# Altium schematic sheet 07_ANALOG_INPUTS.SchDoc: Схема электрическая принципиальная
size 420 x 297 mm; ApprovedBy: Скрябин; CheckedBy: Скрябин; Author: Корсунов; CompanyName: РТУ МИРЭА; SheetNumber: 7; SheetTotal: 11; PageSetup: Record=PageOptions|CenterHorizontal=True|CenterVertical=True|PrintScale=0.94|XCorrection=1.00|YCorrection=1.00|PrintKind=1|BorderSize=5000000|LeftOffset=0|BottomOffset=0|Orientation=1|PaperLength=1000|PaperWidth=1000|Scale=100|PaperSource=7|PrintQuality=-4|MediaType=1|DitherType=10|PaperKind=A4|PrintScaleMode=1; DecimalNumber: RP23.000001.007 Э3; Name1: Модуль ввода-вывода; lit_A: О; Name2: RP2350 OPC UA
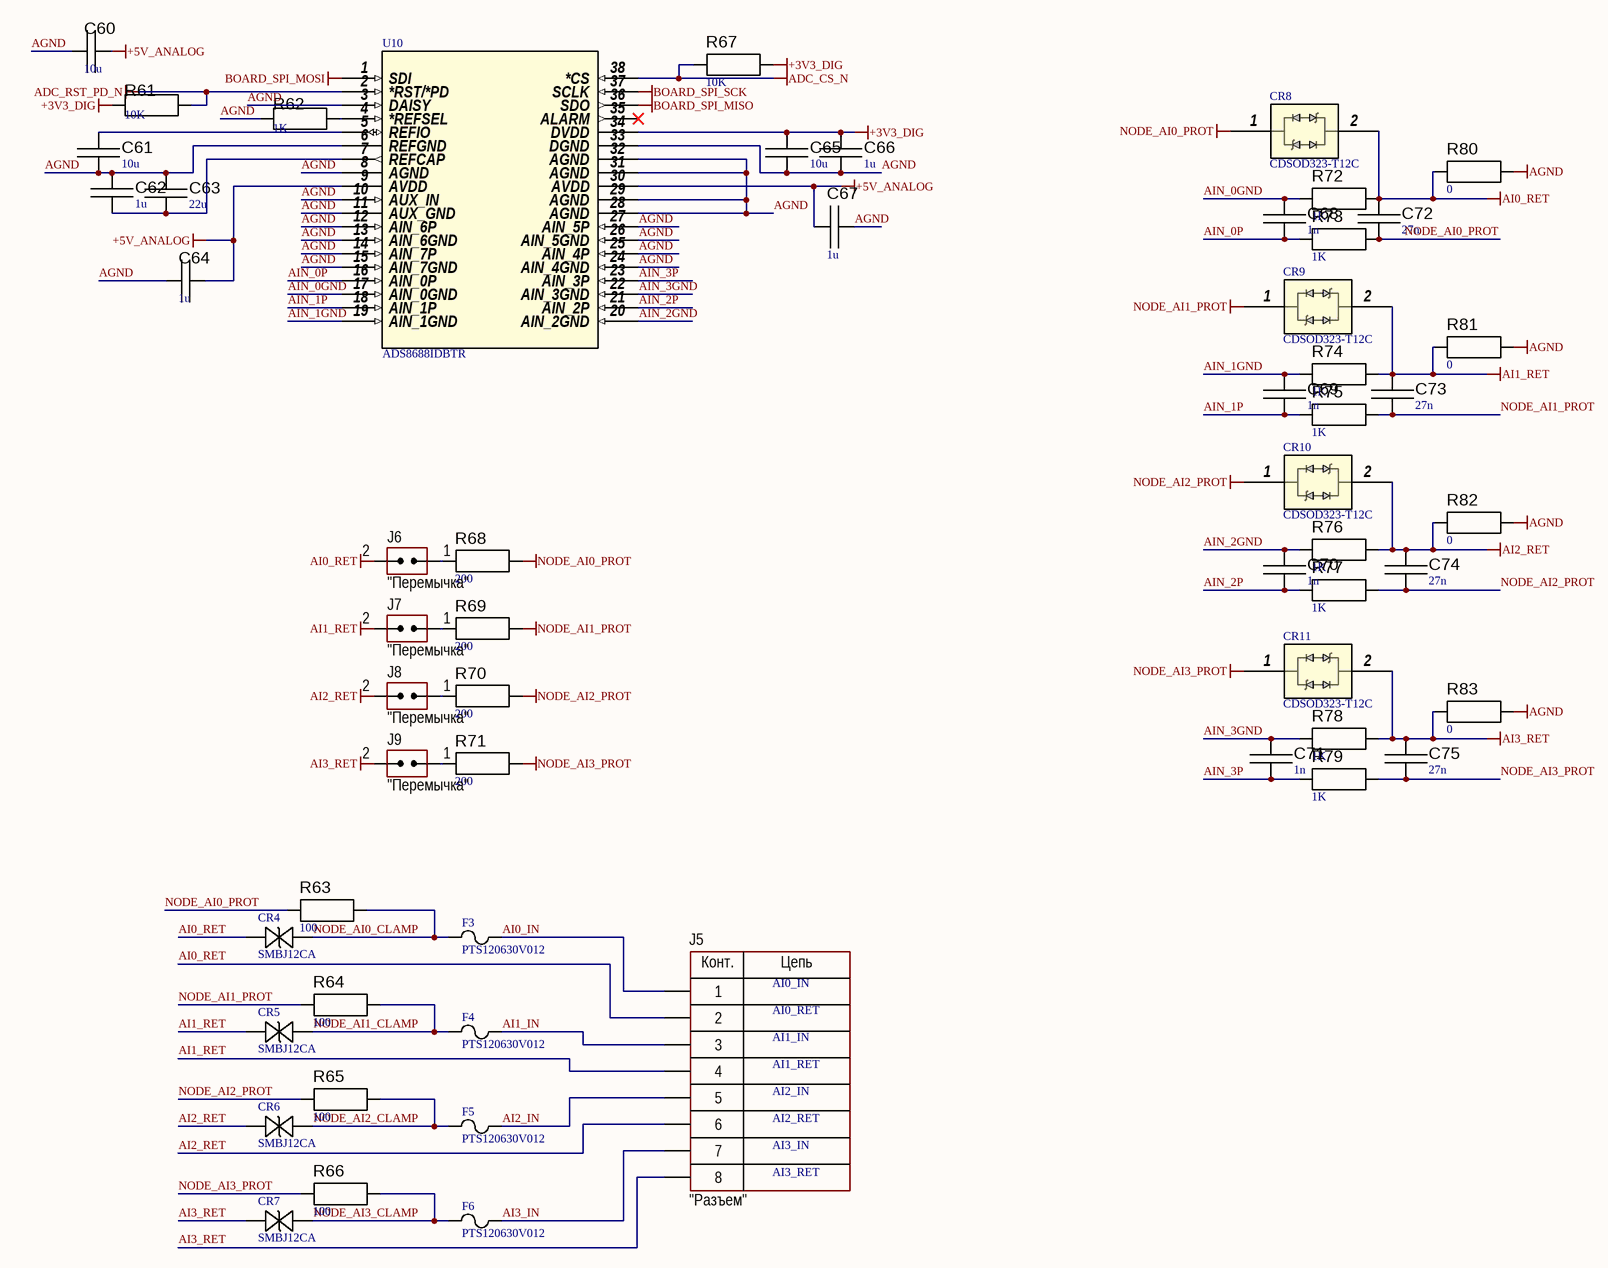
[diagram p0: 07_ANALOG_INPUTS.SchDoc]

## Parts
C60  value 10u  [C_1206]  (hidden comment: Capacitor)
C61  value 10u  [C_1206]  (hidden comment: Capacitor)
C62  value 1u  [C_0603]  (hidden comment: Capacitor)
C63  value 22u  [C_1210]  (hidden comment: Capacitor)
C64  value 1u  [C_0603]  (hidden comment: Capacitor)
C65  value 10u  [C_1206]  (hidden comment: Capacitor)
C66  value 1u  [C_0603]  (hidden comment: Capacitor)
C67  value 1u  [C_0603]  (hidden comment: Capacitor)
C68  value 1n  [C_0603]  (hidden comment: Capacitor)
C69  value 1n  [C_0603]  (hidden comment: Capacitor)
C70  value 1n  [C_0603]  (hidden comment: Capacitor)
C71  value 1n  [C_0603]  (hidden comment: Capacitor)
C72  value 27n  [C_0603]  (hidden comment: Capacitor)
C73  value 27n  [C_0603]  (hidden comment: Capacitor)
C74  value 27n  [C_0603]  (hidden comment: Capacitor)
C75  value 27n  [C_0603]  (hidden comment: Capacitor)
CR4  SMBJ12CA  [SMBJSeries_LTF]
CR5  SMBJ12CA  [SMBJSeries_LTF]
CR6  SMBJ12CA  [SMBJSeries_LTF]
CR7  SMBJ12CA  [SMBJSeries_LTF]
CR8  CDSOD323-T12C  [CDSOD_BIDI_BRN]
CR9  CDSOD323-T12C  [CDSOD_BIDI_BRN]
CR10  CDSOD323-T12C  [CDSOD_BIDI_BRN]
CR11  CDSOD323-T12C  [CDSOD_BIDI_BRN]
F3  PTS120630V012  [FUSE_PTS1206_EAT]
F4  PTS120630V012  [FUSE_PTS1206_EAT]
F5  PTS120630V012  [FUSE_PTS1206_EAT]
F6  PTS120630V012  [FUSE_PTS1206_EAT]
J5  CommentText: "Разъем"  [CON: 15EDGRC-3.5-08 (or 691322110008)]
J6  CommentText: "Перемычка"  [CON: JUMPER x1]
J7  CommentText: "Перемычка"  [CON: JUMPER x1]
J8  CommentText: "Перемычка"  [CON: JUMPER x1]
J9  CommentText: "Перемычка"  [CON: JUMPER x1]
R61  value 10K  [R_0603]  (hidden comment: Resistor)
R62  value 1K  [R_0603]  (hidden comment: Resistor)
R63  value 100  [R_0603]  (hidden comment: Resistor)
R64  value 100  [R_0603]  (hidden comment: Resistor)
R65  value 100  [R_0603]  (hidden comment: Resistor)
R66  value 100  [R_0603]  (hidden comment: Resistor)
R67  value 10K  [R_0603]  (hidden comment: Resistor)
R68  value 200  [R_0603]  (hidden comment: Resistor)
R69  value 200  [R_0603]  (hidden comment: Resistor)
R70  value 200  [R_0603]  (hidden comment: Resistor)
R71  value 200  [R_0603]  (hidden comment: Resistor)
R72  value 1K  [R_0603]  (hidden comment: Resistor)
R73  value 1K  [R_0603]  (hidden comment: Resistor)
R74  value 1K  [R_0603]  (hidden comment: Resistor)
R75  value 1K  [R_0603]  (hidden comment: Resistor)
R76  value 1K  [R_0603]  (hidden comment: Resistor)
R77  value 1K  [R_0603]  (hidden comment: Resistor)
R78  value 1K  [R_0603]  (hidden comment: Resistor)
R79  value 1K  [R_0603]  (hidden comment: Resistor)
R80  value 0  [R_0603]  (hidden comment: Resistor)
R81  value 0  [R_0603]  (hidden comment: Resistor)
R82  value 0  [R_0603]  (hidden comment: Resistor)
R83  value 0  [R_0603]  (hidden comment: Resistor)
U10  ADS8688IDBTR  [DBT38_TEX]

## Nets
+3V3_DIG: C65.2 C66.2 R61.1 R67.1 U10.34(DVDD)
+5V_ANALOG: C60.2 C64.2 C67.2 U10.9(AVDD) U10.30(AVDD)
ADC_CS_N: R67.2 U10.38(*CS)
ADC_RST_PD_N: R61.2 U10.2(*RST/*PD)
AGND: C60.1 C61.1 C62.1 C63.2 C64.1 C65.1 C66.1 C67.1 R62.1 R80.1 R81.1 R82.1 R83.1 U10.3(DAISY) U10.6(REFGND) U10.8(AGND) U10.10(AUX_IN) U10.11(AUX_GND) U10.12(AIN_6P) U10.13(AIN_6GND) U10.14(AIN_7P) U10.15(AIN_7GND) U10.24(AIN_4GND) U10.25(AIN_4P) U10.26(AIN_5GND) U10.27(AIN_5P) U10.28(AGND) U10.29(AGND) U10.31(AGND) U10.32(AGND) U10.33(DGND)
AI0_RET: C72.1 CR4.2 CR8.2 J5.2 J6.2(IN) R72.1 R80.2
AI1_RET: C73.1 CR5.2 CR9.2 J5.4 J7.2(IN) R74.1 R81.2
AI2_RET: C74.1 CR6.2 CR10.2 J5.6 J8.2(IN) R76.1 R82.2
AI3_RET: C75.1 CR7.2 CR11.2 J5.8 J9.2(IN) R78.1 R83.2
BOARD_SPI_MISO: U10.36(SDO)
BOARD_SPI_MOSI: U10.1(SDI)
BOARD_SPI_SCK: U10.37(SCLK)
NODE_AI0_PROT: C72.2 CR8.1 R63.2 R68.1 R73.1
NODE_AI1_PROT: C73.2 CR9.1 R64.2 R69.1 R75.1
NODE_AI2_PROT: C74.2 CR10.1 R65.2 R70.1 R77.1
NODE_AI3_PROT: C75.2 CR11.1 R66.2 R71.1 R79.1
AI0_IN: F3.2 J5.1
AI1_IN: F4.2 J5.3
AI2_IN: F5.2 J5.5
AI3_IN: F6.2 J5.7
AIN_0GND: C68.1 R72.2 U10.17(AIN_0GND)
AIN_0P: C68.2 R73.2 U10.16(AIN_0P)
AIN_1GND: C69.1 R74.2 U10.19(AIN_1GND)
AIN_1P: C69.2 R75.2 U10.18(AIN_1P)
AIN_2GND: C70.1 R76.2 U10.20(AIN_2GND)
AIN_2P: C70.2 R77.2 U10.21(AIN_2P)
AIN_3GND: C71.1 R78.2 U10.22(AIN_3GND)
AIN_3P: C71.2 R79.2 U10.23(AIN_3P)
NODE_AI0_CLAMP: CR4.1 F3.1 R63.1
NODE_AI1_CLAMP: CR5.1 F4.1 R64.1
NODE_AI2_CLAMP: CR6.1 F5.1 R65.1
NODE_AI3_CLAMP: CR7.1 F6.1 R66.1
NetC61_2: C61.2 U10.5(REFIO)
NetC62_2: C62.2 C63.1 U10.7(REFCAP)
NetJ6_1: J6.1(IN) R68.2
NetJ7_1: J7.1(IN) R69.2
NetJ8_1: J8.1(IN) R70.2
NetJ9_1: J9.1(IN) R71.2
NetR62_2: R62.2 U10.4(*REFSEL)

Not connected (* = marked no-connect by the designer): U10 35(ALARM)*

## Notes on the sheet
- AI0_IN
- AI0_RET
- AI1_IN
- AI1_RET
- AI2_IN
- AI2_RET
- AI3_IN
- AI3_RET
- Перв.примен.
- Справ.№
- Подп. и дата
- Инв.№ дубл.
- Взам.инв.№
- Подп.и дата
- Разраб.
- Изм.
- Лист
- № докум.
- Подп.
- Дата
- Лит.
- Масштаб
- Масса
- Т.контр.
- Пров.
- СХЕМА   ЭЛЕКТРИЧЕСКАЯ
- ПРИНЦИПИАЛЬНАЯ
- Листов
- Инв.№ подл.
- Утв.
- Н.контр.
- Нач.сект.
- Формат  A3
- (in symbol Connector_terminal_8pin) Конт.; Цепь

## Library data of the parts
C60-C75 = Capacitor: SimulationGenericComponent: True
CR4-CR7 = SMBJ12CA: No Description Available; Manufacturer_Name: Littelfuse Inc; Copyright: Copyright (C) 2026 Ultra Librarian. All rights reserved.; Manufacturer_Part_Number: SMBJ12CA
CR8-CR11 = CDSOD323-T12C: No Description Available; Manufacturer_Name: Bourns Electronics; Copyright: Copyright (C) 2026 Ultra Librarian. All rights reserved.; Manufacturer_Part_Number: CDSOD323-T12C; RefDes: RefDes; Type: Type
F3-F6 = PTS120630V012: No Description Available; Manufacturer_Name: Eaton; Copyright: Copyright (C) 2026 Ultra Librarian. All rights reserved.; Manufacturer_Part_Number: PTS120630V012
J5 = Connector_terminal_8pin: Manufacturer: Degson; ValueManufacturerPartNumber: Terminal connector, 6pin, 3.5mm, 300VAC, 10A; PartNumber: DG350-3.5-08P-14; TypeConnector: Terminal connector; VoltageMax: 300VAC; Pitch: 3.5mm; CurrentMax: 10A; Multichannel: 6pin; HelpURL: https://www.compel.ru/infosheet/DEGSON/DG350-3.5-08P-14-00AH
J6-J9 = Jumper_single
R61-R79 = Resistor: TC1: 0; SimulationGenericComponent: True; TC2: 0
R80-R83 = Resistor: SimulationGenericComponent: True; TC1: 0; TC2: 0
U10 = ADS8688IDBTR: 16-bit, 500kSPS 8-channel single-supply SAR ADC with bipolar input ranges 38-TSSOP -40 to 125; Manufacturer_Name: Texas Instruments; Copyright: Copyright (C) 2026 Ultra Librarian. All rights reserved.; Manufacturer_Part_Number: ADS8688IDBTR; RefDes: RefDes; Type: Type